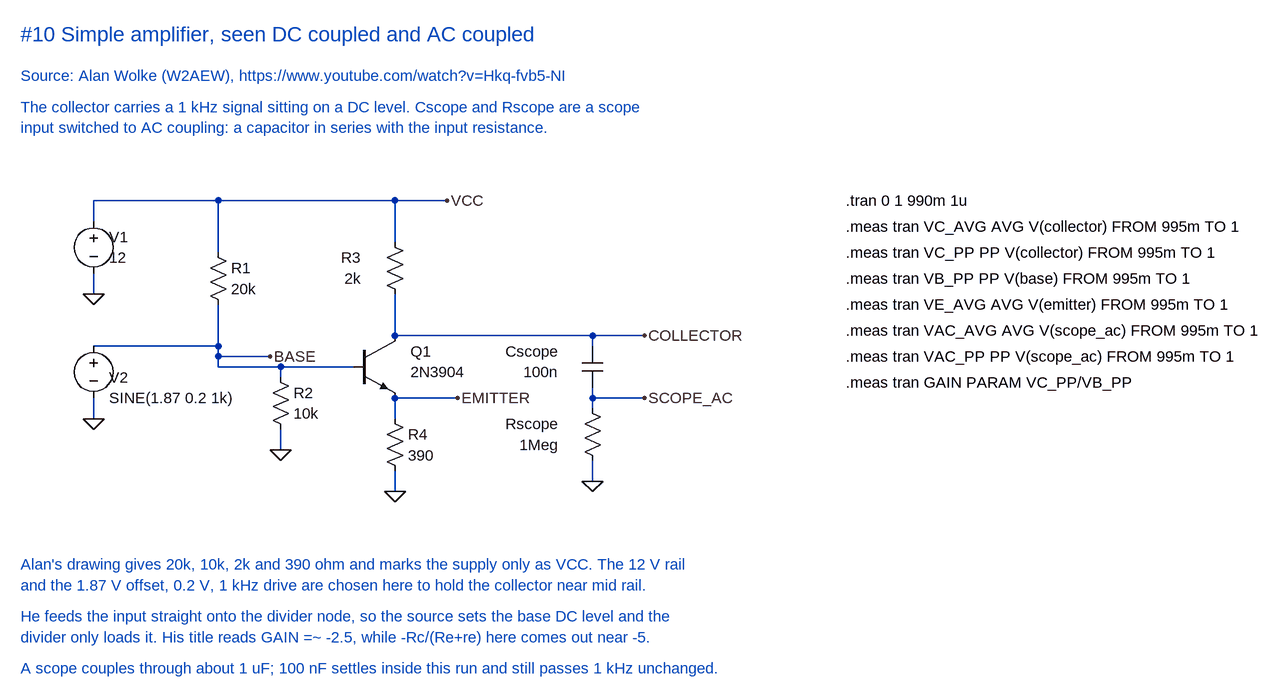
[diagram p0: schematic Simple amplifier.asc]
Simple amplifier.asc, the LTspice schematic file:
Version 4
SHEET 1 2200 1100
WIRE 272 256 464 256
WIRE 464 256 736 256
WIRE 736 256 816 256
WIRE 272 256 272 288
WIRE 272 368 272 400
WIRE 464 256 464 336
WIRE 464 416 464 480
WIRE 272 480 464 480
WIRE 464 480 464 496
WIRE 464 496 464 512
WIRE 464 496 544 496
WIRE 464 512 672 512
WIRE 560 512 560 528
WIRE 560 608 560 640
WIRE 272 560 272 592
WIRE 736 256 736 320
WIRE 736 400 736 464
WIRE 736 464 1040 464
WIRE 1040 464 1120 464
WIRE 1040 464 1040 480
WIRE 1040 544 1040 560
WIRE 1040 560 1040 576
WIRE 1040 560 1120 560
WIRE 1040 656 1040 688
WIRE 736 560 736 592
WIRE 736 560 832 560
WIRE 736 672 736 704
FLAG 272 400 0
FLAG 272 592 0
FLAG 560 640 0
FLAG 736 704 0
FLAG 1040 688 0
FLAG 816 256 VCC
FLAG 544 496 BASE
FLAG 1120 464 COLLECTOR
FLAG 832 560 EMITTER
FLAG 1120 560 SCOPE_AC
SYMBOL voltage 272 272 R0
WINDOW 0 24 40 Left 2
WINDOW 3 24 72 Left 2
SYMATTR InstName V1
SYMATTR Value 12
SYMBOL voltage 272 464 R0
WINDOW 0 24 64 Left 2
WINDOW 3 24 96 Left 2
SYMATTR InstName V2
SYMATTR Value SINE(1.87 0.2 1k)
SYMBOL res 448 320 R0
WINDOW 0 36 40 Left 2
WINDOW 3 36 72 Left 2
SYMATTR InstName R1
SYMATTR Value 20k
SYMBOL res 544 512 R0
WINDOW 0 36 40 Left 2
WINDOW 3 36 72 Left 2
SYMATTR InstName R2
SYMATTR Value 10k
SYMBOL res 720 304 R0
WINDOW 0 -36 40 Right 2
WINDOW 3 -36 72 Right 2
SYMATTR InstName R3
SYMATTR Value 2k
SYMBOL res 720 576 R0
WINDOW 0 36 40 Left 2
WINDOW 3 36 72 Left 2
SYMATTR InstName R4
SYMATTR Value 390
SYMBOL npn 672 464 R0
WINDOW 0 88 24 Left 2
WINDOW 3 88 56 Left 2
SYMATTR InstName Q1
SYMATTR Value 2N3904
SYMBOL cap 1024 480 R0
WINDOW 0 -36 8 Right 2
WINDOW 3 -36 40 Right 2
SYMATTR InstName Cscope
SYMATTR Value 100n
SYMBOL res 1024 560 R0
WINDOW 0 -36 40 Right 2
WINDOW 3 -36 72 Right 2
SYMATTR InstName Rscope
SYMATTR Value 1Meg
TEXT 160 0 Left 3 ;#10 Simple amplifier, seen DC coupled and AC coupled
TEXT 160 64 Left 2 ;Source: Alan Wolke (W2AEW), https://www.youtube.com/watch?v=Hkq-fvb5-NI
TEXT 160 112 Left 2 ;The collector carries a 1 kHz signal sitting on a DC level. Cscope and Rscope are a scope
TEXT 160 144 Left 2 ;input switched to AC coupling: a capacitor in series with the input resistance.
TEXT 1430 256 Left 2 !.tran 0 1 990m 1u
TEXT 1430 296 Left 2 !.meas tran VC_AVG AVG V(collector) FROM 995m TO 1
TEXT 1430 336 Left 2 !.meas tran VC_PP PP V(collector) FROM 995m TO 1
TEXT 1430 376 Left 2 !.meas tran VB_PP PP V(base) FROM 995m TO 1
TEXT 1430 416 Left 2 !.meas tran VE_AVG AVG V(emitter) FROM 995m TO 1
TEXT 1430 456 Left 2 !.meas tran VAC_AVG AVG V(scope_ac) FROM 995m TO 1
TEXT 1430 496 Left 2 !.meas tran VAC_PP PP V(scope_ac) FROM 995m TO 1
TEXT 1430 536 Left 2 !.meas tran GAIN PARAM VC_PP/VB_PP
TEXT 160 816 Left 2 ;Alan's drawing gives 20k, 10k, 2k and 390 ohm and marks the supply only as VCC. The 12 V rail
TEXT 160 848 Left 2 ;and the 1.87 V offset, 0.2 V, 1 kHz drive are chosen here to hold the collector near mid rail.
TEXT 160 896 Left 2 ;He feeds the input straight onto the divider node, so the source sets the base DC level and the
TEXT 160 928 Left 2 ;divider only loads it. His title reads GAIN =~ -2.5, while -Rc/(Re+re) here comes out near -5.
TEXT 160 976 Left 2 ;A scope couples through about 1 uF; 100 nF settles inside this run and still passes 1 kHz unchanged.

The netlist it stands for:
* Simple amplifier.asc
V1 VCC 0 12
V2 BASE 0 SINE(1.87 0.2 1k)
R1 VCC BASE 20k
R2 BASE 0 10k
R3 VCC COLLECTOR 2k
R4 EMITTER 0 390
Q1 COLLECTOR BASE EMITTER 0 2N3904
Cscope COLLECTOR SCOPE_AC 100n
Rscope SCOPE_AC 0 1Meg
.model NPN NPN
.model PNP PNP
.lib standard.bjt
* #10 Simple amplifier, seen DC coupled and AC coupled
* Source: Alan Wolke (W2AEW), https://www.youtube.com/watch?v=Hkq-fvb5-NI
* The collector carries a 1 kHz signal sitting on a DC level. Cscope and Rscope are a scope
* input switched to AC coupling: a capacitor in series with the input resistance.
.tran 0 1 990m 1u
.meas tran VC_AVG AVG V(collector) FROM 995m TO 1
.meas tran VC_PP PP V(collector) FROM 995m TO 1
.meas tran VB_PP PP V(base) FROM 995m TO 1
.meas tran VE_AVG AVG V(emitter) FROM 995m TO 1
.meas tran VAC_AVG AVG V(scope_ac) FROM 995m TO 1
.meas tran VAC_PP PP V(scope_ac) FROM 995m TO 1
.meas tran GAIN PARAM VC_PP/VB_PP
* Alan's drawing gives 20k, 10k, 2k and 390 ohm and marks the supply only as VCC. The 12 V rail
* and the 1.87 V offset, 0.2 V, 1 kHz drive are chosen here to hold the collector near mid rail.
* He feeds the input straight onto the divider node, so the source sets the base DC level and the
* divider only loads it. His title reads GAIN =~ -2.5, while -Rc/(Re+re) here comes out near -5.
* A scope couples through about 1 uF; 100 nF settles inside this run and still passes 1 kHz unchanged.
.backanno
.end